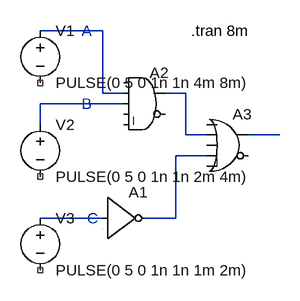
[diagram p0: schematic 13.asc]
13.asc, the LTspice schematic file:
Version 4.1
SHEET 1 880 680
WIRE 160 32 64 32
WIRE 160 128 160 32
WIRE 192 128 160 128
WIRE 288 128 256 128
WIRE 192 144 64 144
WIRE 64 176 64 144
WIRE 288 192 288 128
WIRE 320 192 288 192
WIRE 432 192 384 192
WIRE 320 224 272 224
WIRE 160 320 64 320
WIRE 272 320 272 224
WIRE 272 320 224 320
SYMBOL voltage 64 16 R0
WINDOW 123 0 0 Left 0
WINDOW 39 0 0 Left 0
SYMATTR InstName V1
SYMATTR Value PULSE(0 5 0 1n 1n 4m 8m)
SYMBOL voltage 64 160 R0
WINDOW 123 0 0 Left 0
WINDOW 39 0 0 Left 0
SYMATTR InstName V2
SYMATTR Value PULSE(0 5 0 1n 1n 2m 4m)
SYMBOL voltage 64 304 R0
WINDOW 123 0 0 Left 0
WINDOW 39 0 0 Left 0
SYMATTR InstName V3
SYMATTR Value PULSE(0 5 0 1n 1n 1m 2m)
SYMBOL Digital\\inv 160 256 R0
SYMATTR InstName A1
SYMBOL Digital\\and 224 80 R0
SYMATTR InstName A2
SYMBOL Digital\\or 352 144 R0
SYMATTR InstName A3
TEXT 128 32 Left 2 ;A
TEXT 128 144 Left 2 ;B
TEXT 136 320 Left 2 ;C
TEXT 296 32 Left 2 !.tran 8m

The netlist it stands for:
* 13.asc
V1 N001 NC_01 PULSE(0 5 0 1n 1n 4m 8m)
V2 N003 NC_02 PULSE(0 5 0 1n 1n 2m 4m)
V3 N006 NC_03 PULSE(0 5 0 1n 1n 1m 2m)
A1 N006 0 0 0 0 N005 0 0 BUF
A2 0 N001 N003 0 0 0 N002 0 AND
A3 0 N002 0 N005 0 0 N004 0 OR
* A
* B
* C
.tran 8m
.backanno
.end